# Altium schematic sheet RC Receiver Section.SchDoc
size A; DocumentNumber: 2; SheetNumber: 2; SheetTotal: 4
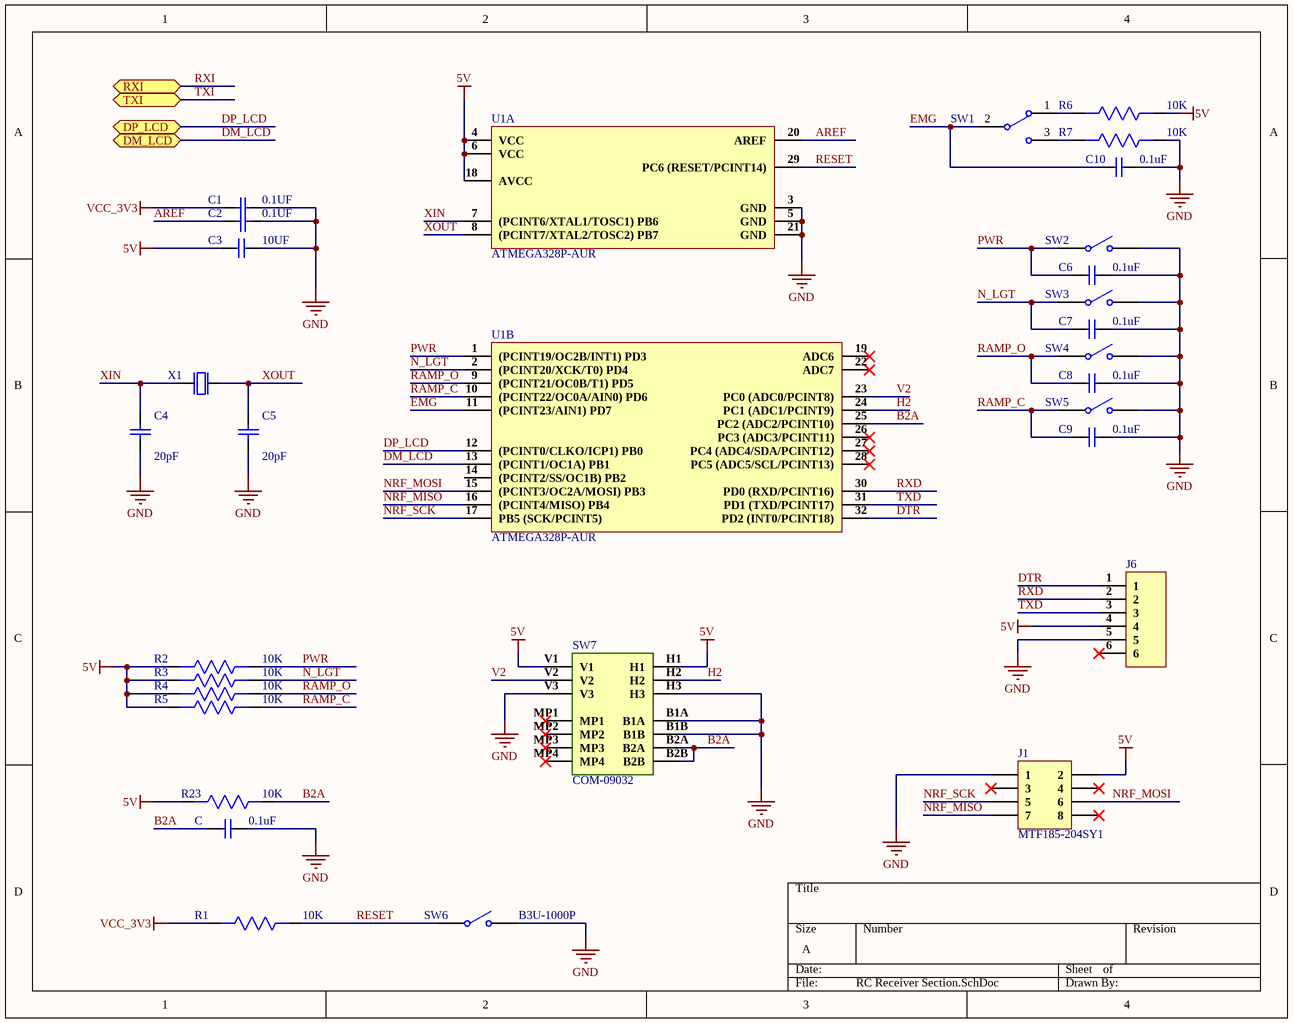
[diagram p0: RC Receiver Section.SchDoc]

## Parts
C  0.1uF  [CAP 0402]
C1  0.1UF  [CAP 0402]
C2  0.1UF  [CAP 0402]
C3  10UF  [Cap0805]
C4  20pF  [Cap0805]
C5  20pF  [Cap0805]
C6  0.1uF  [CAP 0402]
C7  0.1uF  [CAP 0402]
C8  0.1uF  [CAP 0402]
C9  0.1uF  [CAP 0402]
C10  0.1uF  [CAP 0402]
J1  MTF185-204SY1  [MTF185-204SY1]
J6  C40877  [C40877]  (value not drawn)
R1  10K  [Res-0201]
R2  10K  [Res-0201]
R3  10K  [Res-0201]
R4  10K  [Res-0201]
R5  10K  [Res-0201]
R6  10K  [Res-0201]
R7  10K  [Res-0201]
R23  10K  [Res-0201]
SW1  100SP1T1B4M2QE  [100SP1T1B4M2QE]  (value not drawn)
SW2  B3U-1000P  [B3U-1000P]  (value not drawn)
SW3  B3U-1000P  [B3U-1000P]  (value not drawn)
SW4  B3U-1000P  [B3U-1000P]  (value not drawn)
SW5  B3U-1000P  [B3U-1000P]  (value not drawn)
SW6  B3U-1000P  [B3U-1000P]
SW7  COM-09032  [JOYSTICK]
U1  ATMEGA328P-AUR  [32 TQFP]  (parts A,B of 2)
X1  ECS-200-20-3X-EN-TR  [ECS-200-20-3X-EN-TR]  (value not drawn)

## Ports
DM_LCD (bidir), DP_LCD (bidir), RXI (bidir), TXI (bidir)

## Nets
5V: C3.1 J1.2 J6.4 R2.2 R3.2 R4.2 R5.2 R6.1 R23.2 SW7.H1 SW7.V1 U1.4(VCC) U1.6(VCC) U1.18(AVCC)
GND: C.2 C1.1 C2.1 C3.2 C4.2 C5.2 C6.2 C7.2 C8.2 C9.2 C10.2 J1.1 J6.5 R7.1 SW2.2 SW3.2 SW4.2 SW5.2 SW6.2 SW7.B1A SW7.B1B SW7.H3 SW7.V3 U1.3(GND) U1.5(GND) U1.21(GND)
VCC_3V3: C1.2 R1.2
AREF: C2.2 U1.20(AREF)
B2A: C.1 R23.1 SW7.B2A SW7.B2B U1.25(PC2_(ADC2/PCINT10))
DM_LCD: U1.13((PCINT1/OC1A)_PB1) ; port DM_LCD
DP_LCD: U1.12((PCINT0/CLKO/ICP1)_PB0) ; port DP_LCD
DTR: J6.1 U1.32(PD2_(INT0/PCINT18))
EMG: C10.1 SW1.2 U1.11((PCINT23/AIN1)_PD7)
H2: SW7.H2 U1.24(PC1_(ADC1/PCINT9))
N_LGT: C7.1 R3.1 SW3.1 U1.2((PCINT20/XCK/T0)_PD4)
NRF_MISO: J1.7 U1.16((PCINT4/MISO)_PB4)
NRF_MOSI: J1.6 U1.15((PCINT3/OC2A/MOSI)_PB3)
NRF_SCK: J1.5 U1.17(PB5_(SCK/PCINT5))
PWR: C6.1 R2.1 SW2.1 U1.1((PCINT19/OC2B/INT1)_PD3)
RAMP_C: C9.1 R5.1 SW5.1 U1.10((PCINT22/OC0A/AIN0)_PD6)
RAMP_O: C8.1 R4.1 SW4.1 U1.9((PCINT21/OC0B/T1)_PD5)
RESET: R1.1 SW6.1 U1.29(PC6_(RESET/PCINT14))
RXD: J6.2 U1.30(PD0_(RXD/PCINT16))
RXI: port RXI
TXD: J6.3 U1.31(PD1_(TXD/PCINT17))
TXI: port TXI
V2: SW7.V2 U1.23(PC0_(ADC0/PCINT8))
XIN: C4.1 U1.7((PCINT6/XTAL1/TOSC1)_PB6) X1.1(inp)
XOUT: C5.1 U1.8((PCINT7/XTAL2/TOSC2)_PB7) X1.2(out)
NetR6_2: R6.2 SW1.1
NetR7_2: R7.2 SW1.3

Not connected (* = marked no-connect by the designer): J1 3* 4* 8*; J6 6*; SW7 MP1* MP2* MP3* MP4*; U1 14((PCINT2/SS/OC1B)_PB2) 19(ADC6)* 22(ADC7)* 26(PC3_(ADC3/PCINT11))* 27(PC4_(ADC4/SDA/PCINT12))* 28(PC5_(ADC5/SCL/PCINT13))*

## Library data of the parts
C C6-C10 = CC0402KRX7R7BB104: CAP CER 0.1UF 16V X7R 0402; Manufacturer: Yageo; Tolerance: 10%; Capacitance: 100nF; Supplier 1: Digi-Key; Manufacturer Part Number: CC0402KRX7R7BB104; Stock 1: 9987374; Pricing 1: 1=0.1, 10=0.034, 100=0.015, 500=0.0107, 1000=0.00841, 2500=0.00764, 5000=0.00703 (USD); Mount: Surface Mount; Case/Package: 0402; Number of Pins: 2; Case Code (Metric): 1005; Case Code (Imperial): 0402; Min Operating Temperature: -55°C; Max Operating Temperature: 125°C; Dielectric: X7R; Voltage Rating: 16V; Voltage Rating (DC): 16V; Packaging: Tape and Reel; Package Quantity: 1; Termination: SMD/SMT; Composition: Ceramic; Voltage: 16V; Length: 1mm; Height: 0.5mm; Width: 0.02inch; Thickness: 0.022inch; Depth: 0.5mm; Radiation Hardening: No; REACH SVHC: No SVHC; Lead Free: Lead Free; Halogen Free: Halogen Free; ComponentLink1URL: http://www.yageo.com/documents/recent/UPY-GPHC_X7R_6.3V-to-50V_8.pdf?src-supplier=Avnet+Europe; ComponentLink1Description: http://www.yageo.com/documents/recent/UPY-GPHC_X7R_6.3V-to-50V_8.pdf?src-supplier=Avnet+Europe; ComponentLink2URL: http://www.yageo.com/documents/recent/UPY-GPHC_X7R_6.3V-to-50V_18.pdf?src-supplier=Digi-Key; ComponentLink2Description: http://www.yageo.com/documents/recent/UPY-GPHC_X7R_6.3V-to-50V_18.pdf?src-supplier=Digi-Key; ComponentLink3URL: http://www.yageo.com/documents/recent/UPY-GPHC_X7R_6.3V-to-50V_8.pdf?src-supplier=Avnet; ComponentLink3Description: http://www.yageo.com/documents/recent/UPY-GPHC_X7R_6.3V-to-50V_8.pdf?src-supplier=Avnet; ComponentLink4URL: http://www.yageo.com/documents/recent/UPY-GPHC_X7R_6.3V-to-50V_18.pdf?src-supplier=Mouser; ComponentLink4Description: http://www.yageo.com/documents/recent/UPY-GPHC_X7R_6.3V-to-50V_18.pdf?src-supplier=Mouser; ComponentLink5URL: http://www.farnell.com/datasheets/2167236.pdf?src-supplier=Element14; ComponentLink5Description: http://www.farnell.com/datasheets/2167236.pdf?src-supplier=Element14; ComponentLink6URL: http://www.farnell.com/datasheets/1489800.pdf?src-supplier=Element14; ComponentLink6Description: http://www.farnell.com/datasheets/1489800.pdf?src-supplier=Element14; Supplier Part Number 1: 311-1338-1-ND
C1 C2 = C0402C104Z4VAC7867: 0.1µF -20%, +80% 16V Ceramic Capacitor Y5V (F) 0402 (1005 Metric); Manufacturer: KEMET; Manufacturer Part Number: C0402C104Z4VACTU; Tolerance: 80%; Capacitance: 100nF; Supplier 1: Digi-Key; Stock 1: 1342942; Pricing 1: 1=0.1, 10=0.018, 100=0.0081, 500=0.00578, 1000=0.00454, 2500=0.00412, 5000=0.0038 (USD); Mount: Surface Mount; Case/Package: 0402; Dielectric Material: Ceramic; Min Operating Temperature: -30°C; Max Operating Temperature: 85°C; Dielectric: Y5V; Packaging: Tape and Reel; Voltage Rating (DC): 16V; Length: 1mm; Height: 0.5mm; Depth: 0.5mm; Radiation Hardening: No; Lead Free: Lead Free; ComponentLink1URL: https://www.verical.com/server-webapp/html/getDatasheet?partID=764272&src-supplier=Verical; ComponentLink1Description: https://www.verical.com/server-webapp/html/getDatasheet?partID=764272&src-supplier=Verical; Supplier Part Number 1: 399-1043-6-ND
C3 = CL21A106KOQNNNG: CAP CER 10UF 16V X5R 0805; Manufacturer: Samsung; Material: Ceramic; Tolerance: 10%; Supplier 1: Digi-Key; Manufacturer Part Number: CL21A106KOQNNNG; Stock 1: 69664; Pricing 1: 1=0.11, 10=0.076, 50=0.0434, 100=0.0359, 500=0.02516, 1000=0.02083 (USD); Mount: Surface Mount; Case/Package: 0805; Case Code (Metric): 2012; Case Code (Imperial): 0805; Min Operating Temperature: -55°C; Max Operating Temperature: 85°C; Capacitance: 10uF; Dielectric: X5R; Voltage: 16V; Packaging: Tape and Reel; Package Quantity: 3000; Voltage Rating: 16V; Length: 2mm; Height: 1.25mm; Depth: 1.25mm; Width: 0.049inch; Thickness: 0.053inch; ComponentLink1URL: http://www.samsungsem.com/kr/support/product-search/mlcc/CL21A106KOQNNNG.jsp?src-supplier=Digi-Key; ComponentLink1Description: http://www.samsungsem.com/kr/support/product-search/mlcc/CL21A106KOQNNNG.jsp?src-supplier=Digi-Key; ComponentLink2URL: https://produktinfo.conrad.com/datenblaetter/450000-474999/454932-da-01-en-VS_KONDENSATOR_0805.pdf?src-supplier=Conrad; ComponentLink2Description: https://produktinfo.conrad.com/datenblaetter/450000-474999/454932-da-01-en-VS_KONDENSATOR_0805.pdf?src-supplier=Conrad; Supplier Part Number 1: 1276-6455-6-ND
C4 C5 = C0805C200J4GAC7800: CAP CER 20PF 16V C0G/NP0 0805; Manufacturer: KEMET; Manufacturer Part Number: C0805C200J4GACTU; Dielectric Material: Ceramic; Tolerance: 5%; Dielectric: C0G; Supplier 1: Digi-Key; Stock 1: 9766; Pricing 1: 1=0.32, 10=0.218, 50=0.1452, 100=0.1234, 500=0.08712, 1000=0.07623 (USD); Mount: Surface Mount; Case/Package: 0805; Weight: 0.000194oz; Case Code (Imperial): 0805; Case Code (Metric): 2012; Min Operating Temperature: -55°C; Max Operating Temperature: 125°C; Capacitance: 20pF; Voltage Rating (DC): 16V; Packaging: Tape and Reel; Package Quantity: 1; Termination: SMD/SMT; Length: 2mm; Height: 0.78mm; Width: 0.049inch; Thickness: 0.035inch; Depth: 1.25mm; Lead Free: Lead Free; ComponentLink1URL: https://search.kemet.com/component-edge/download/datasheet/C0805C200J4GAC7800.pdf?src-supplier=Digi-Key; ComponentLink1Description: https://search.kemet.com/component-edge/download/datasheet/C0805C200J4GAC7800.pdf?src-supplier=Digi-Key; ComponentLink2URL: https://api.kemet.com/component-edge/download/datasheet/C0805C200J4GAC7800.pdf?src-supplier=Digi-Key; ComponentLink2Description: https://api.kemet.com/component-edge/download/datasheet/C0805C200J4GAC7800.pdf?src-supplier=Digi-Key; ComponentLink3URL: http://components.arrow.com/part/dataview/0323_04089801?src-supplier=Arrow+Europe; ComponentLink3Description: http://components.arrow.com/part/dataview/0323_04089801?src-supplier=Arrow+Europe; ComponentLink4URL: http://www.farnell.com/datasheets/2746350.pdf?src-supplier=Farnell; ComponentLink4Description: http://www.farnell.com/datasheets/2746350.pdf?src-supplier=Farnell; ComponentLink5URL: http://www.mouser.com/ds/2/212/KEM_C1003_C0G_SMD-1101588.pdf?src-supplier=Mouser; ComponentLink5Description: http://www.mouser.com/ds/2/212/KEM_C1003_C0G_SMD-1101588.pdf?src-supplier=Mouser; ComponentLink6URL: http://www.farnell.com/datasheets/2746350.pdf?src-supplier=Newark; ComponentLink6Description: http://www.farnell.com/datasheets/2746350.pdf?src-supplier=Newark; Supplier Part Number 1: 399-9987-6-ND
J1 = MTF185-204SY1: Female Header Female Socket 0.100"(2.54mm) 8 2 Through Hole,P=2.54mm Pin Header & Female Header RoHS
J6 = C40877: Female Header Female Socket 0.100"(2.54mm)
R1-R7 R23 = RC0201JR-0710KL: RES SMD 10K OHM 5% 1/20W 0201; Manufacturer: Yageo; Resistance: 10kR; Temperature Coefficient: 200ppm/°C; Power Rating: 50mW; Voltage Rating: 25V; Supplier 1: Digi-Key; Manufacturer Part Number: RC0201JR-0710KL; Stock 1: 1378070; Pricing 1: 1=0.1, 10=0.028, 100=0.0115, 1000=0.00517, 2500=0.00448, 5000=0.00371 (USD); Case/Package: 0201; Contact Plating: Tin,Matte; Case Code (Imperial): 0201; Case Code (Metric): 0603; Min Operating Temperature: -55°C; Max Operating Temperature: 125°C; Tolerance: 5%; Composition: Thick Film; Packaging: Tape and Reel; Termination: SMD/SMT; Military Standard: Not; Voltage Rating (DC): 25V; Length: 0.6mm; Depth: 0.3mm; Radiation Hardening: No; REACH SVHC: Unknown; Lead Free: Lead Free; ComponentLink1URL: http://www.farnell.com/datasheets/2167052.pdf?src-supplier=Element14; ComponentLink1Description: http://www.farnell.com/datasheets/2167052.pdf?src-supplier=Element14; ComponentLink2URL: http://www.yageo.com/documents/recent/PYu-RC0201_51_RoHS_L_8.pdf?src-supplier=Avnet+Europe; ComponentLink2Description: http://www.yageo.com/documents/recent/PYu-RC0201_51_RoHS_L_8.pdf?src-supplier=Avnet+Europe; ComponentLink3URL: http://www.yageo.com/documents/recent/PYu-RC0201_51_RoHS_L_8.pdf?src-supplier=Avnet; ComponentLink3Description: http://www.yageo.com/documents/recent/PYu-RC0201_51_RoHS_L_8.pdf?src-supplier=Avnet; Supplier Part Number 1: 311-10KNDKR-ND
SW1 = 100SP1T1B4M2QE: SWITCH TOGGLE SPDT 5A 120V; Manufacturer: E-Switch; Actuator Material: Brass,Chrome; Voltage Rating (DC): 28V; Illumination Type: Non-Illuminated,Illuminated; Switch Function: On-On; Electrical Life: 40000Cycles; Actuator Type: Standard Round; Actuator Length: 12.19mm; Supplier 1: Digi-Key; Manufacturer Part Number: 100SP1T1B4M2QE; Stock 1: 11088; Pricing 1: 1=1.99, 10=1.779, 25=1.6824, 50=1.602, 100=1.5295, 250=1.46512, 500=1.3685, 1000=1.3041 (USD); Mount: Through Hole; Contact Material: Silver; Contact Plating: Silver; Min Operating Temperature: -30°C; Max Operating Temperature: 85°C; Package Quantity: 1; Current Rating: 5A; Voltage Rating (AC): 120V; Packaging: Bulk; Termination: PC Pin; Throw Configuration: SPDT; Orientation: Vertical; Lead Free: Lead Free; ComponentLink1URL: https://www.e-switch.com/system/asset/product_line/data_sheet/129/100.pdf?src-supplier=Digi-Key; ComponentLink1Description: https://www.e-switch.com/system/asset/product_line/data_sheet/129/100.pdf?src-supplier=Digi-Key; ComponentLink2URL: http://www.onlinecomponents.com/productFiles/mf-EC/T111597.pdf?src-supplier=Onlinecomponents.com; ComponentLink2Description: http://www.onlinecomponents.com/productFiles/mf-EC/T111597.pdf?src-supplier=Onlinecomponents.com; Supplier Part Number 1: EG2355-ND
SW2-SW6 = B3U-1000P: SWITCH TACTILE SPST-NO 0.05A 12V; Manufacturer: Omron; Mechanical Life: 200000Cycles; Operating Force: 1.5N; Throw Configuration: SPST; Current Rating: 50mA; Contact Resistance: 100mR; Illumination Type: Non-Illuminated,Illuminated; Switch Travel: 0.15mm; Switch Function: Off-Mom; Actuator Type: Standard; Actuator Length: 0.4mm; Ratings: Dust Proof,IP40; ComponentLink1URL: http://www.farnell.com/datasheets/60838.pdf?src-supplier=Farnell; ComponentLink1Description: http://www.farnell.com/datasheets/60838.pdf?src-supplier=Farnell; ComponentLink2URL: http://www.farnell.com/datasheets/60838.pdf?src-supplier=Element14; ComponentLink2Description: http://www.farnell.com/datasheets/60838.pdf?src-supplier=Element14; ComponentLink3URL: https://omronfs.omron.com/en_US/ecb/products/pdf/en-b3u.pdf?src-supplier=Digi-Key; ComponentLink3Description: https://omronfs.omron.com/en_US/ecb/products/pdf/en-b3u.pdf?src-supplier=Digi-Key; ComponentLink4URL: http://www.omron.com/ecb/products/pdf/en-b3u.pdf?src-supplier=Digi-Key; ComponentLink4Description: http://www.omron.com/ecb/products/pdf/en-b3u.pdf?src-supplier=Digi-Key; ComponentLink5URL: https://www.distrelec.biz/Web/Downloads/he/et/B3U_eng_datasheet.pdf?mime=application%2Fpdf&src-supplier=Distrelec; ComponentLink5Description: https://www.distrelec.biz/Web/Downloads/he/et/B3U_eng_datasheet.pdf?mime=application%2Fpdf&src-supplier=Distrelec; ComponentLink6URL: http://www.onlinecomponents.com/productFiles/mf-OM/en-b3u.pdf?src-supplier=Onlinecomponents.com; ComponentLink6Description: http://www.onlinecomponents.com/productFiles/mf-OM/en-b3u.pdf?src-supplier=Onlinecomponents.com; Supplier 1: Digi-Key; Manufacturer Part Number: B3U-1000P; Stock 1: 116454; Pricing 1: 1=1, 10=0.961, 25=0.9064, 50=0.7976, 100=0.7251, 250=0.68888, 500=0.67074, 1000=0.52571 (USD); Mount: Surface Mount; Weight: 0.000776oz; Contact Material: Silver; Min Operating Temperature: -25°C; Max Operating Temperature: 70°C; Packaging: Tape and Reel; Voltage Rating (DC): 12V; Package Quantity: 1; Max Current Rating: 50mA; Termination: SMD/SMT; Orientation: Straight; Max Voltage Rating (DC): 12V; Electrical Life: 200000Cycles; Insulation Resistance: 100MR; Contact Current Rating: 50mA; Length: 4mm; Height: 1.2mm; Depth: 2.5mm; Width: 3mm; REACH SVHC: Unknown; Lead Free: Lead Free; ComponentLink7URL: https://www.verical.com/server-webapp/html/getDatasheet?partID=552554&src-supplier=Verical; ComponentLink7Description: https://www.verical.com/server-webapp/html/getDatasheet?partID=552554&src-supplier=Verical; ComponentLink8URL: http://www.farnell.com/datasheets/1685550.pdf?src-supplier=Element14; ComponentLink8Description: http://www.farnell.com/datasheets/1685550.pdf?src-supplier=Element14; ComponentLink9URL: http://www.farnell.com/datasheets/2610940.pdf?src-supplier=Farnell; ComponentLink9Description: http://www.farnell.com/datasheets/2610940.pdf?src-supplier=Farnell; ComponentLink10URL: https://www.alliedelec.com/m/d/4c8a9ef82804fc3c241a13c1e298fd73.pdf?src-supplier=Allied+Electronics; ComponentLink10Description: https://www.alliedelec.com/m/d/4c8a9ef82804fc3c241a13c1e298fd73.pdf?src-supplier=Allied+Electronics; Supplier Part Number 1: SW1020DKR-ND
SW7 = COM-09032: JOYSTICK 10K OHM 2 AXIS TH; Manufacturer: SparkFun; Supplier 1: Digi-Key; Manufacturer Part Number: COM-09032; Stock 1: 364; Pricing 1: 1=3.95 (USD); ComponentLink1URL: https://media.digikey.com/pdf/Data%20Sheets/Sparkfun%20PDFs/COM-09032_Web.pdf?src-supplier=Digi-Key; ComponentLink1Description: https://media.digikey.com/pdf/Data%20Sheets/Sparkfun%20PDFs/COM-09032_Web.pdf?src-supplier=Digi-Key; Supplier Part Number 1: 1568-1526-ND
U1 = ATMEGA328P-AUR: IC MCU 8BIT 32KB FLASH 32TQFP; Manufacturer: Microchip / Atmel; Frequency: 20MHz; Interface: I2C,SPI,UART,USART; Number of I/Os: 23; Oscillator Type: Internal; Peripherals: Brown-out Detect/Reset,POR,PWM,WDT; Core Architecture: AVR; Min Supply Voltage: 1.8V; Max Supply Voltage: 5.5V; RAM Size: 2KB; Number of Timers/Counters: 3; Data Bus Width: 8b; Watchdog Timer: Yes; Supplier 1: Digi-Key; Manufacturer Part Number: ATMEGA328P-AUR; Stock 1: 16019; Pricing 1: 1=2.08, 25=1.91, 100=1.73 (USD); Mount: Surface Mount; Case/Package: A; Number of Pins: 32; Contact Plating: Tin,Matte; Min Operating Temperature: -40°C; Max Operating Temperature: 85°C; Packaging: Tape and Reel; Memory Type: FLASH; Memory Size: 32KB; Package Quantity: 2000; Number of Programmable I/O: 23; Max Frequency: 20MHz; REACH SVHC: No SVHC; Lead Free: Lead Free; ComponentLink1URL: http://www.microchip.com/mymicrochip/filehandler.aspx?ddocname=en589968&src-supplier=Digi-Key; ComponentLink1Description: http://www.microchip.com/mymicrochip/filehandler.aspx?ddocname=en589968&src-supplier=Digi-Key; Supplier Part Number 1: ATMEGA328P-AURCT-ND
X1 = ECS-200-20-3X-EN-TR: 20MHz ±30ppm Crystal 20pF 50 Ohms HC-49/U; Manufacturer: ECS International; ESR (Equivalent Series Resistance): 50R; Frequency Stability: 50ppm; Supplier 1: Digi-Key; Manufacturer Part Number: ECS-200-20-3X-EN-TR; Stock 1: 19197; Pricing 1: 1=0.53, 10=0.44, 50=0.396, 100=0.352, 500=0.3344, 1000=0.2816 (USD); Mount: Surface Mount; Min Operating Temperature: -40°C; Max Operating Temperature: 85°C; Package Quantity: 1; Frequency: 20MHz; Frequency Tolerance: 30ppm; Load Capacitance: 20pF; Packaging: Tape and Reel; Tolerance: 30ppm; Termination: SMD/SMT; Length: 0.276inch; Height: 0.091inch; Width: 0.161inch; Lead Free: Lead Free; ComponentLink1URL: http://www.ecsxtal.com/store/pdf/CSM-3X.pdf?src-supplier=Digi-Key; ComponentLink1Description: http://www.ecsxtal.com/store/pdf/CSM-3X.pdf?src-supplier=Digi-Key; Supplier Part Number 1: XC1796DKR-ND